# EAGLE design untitledok (EAGLE 7.6.0)

## Sheet 1 of 3
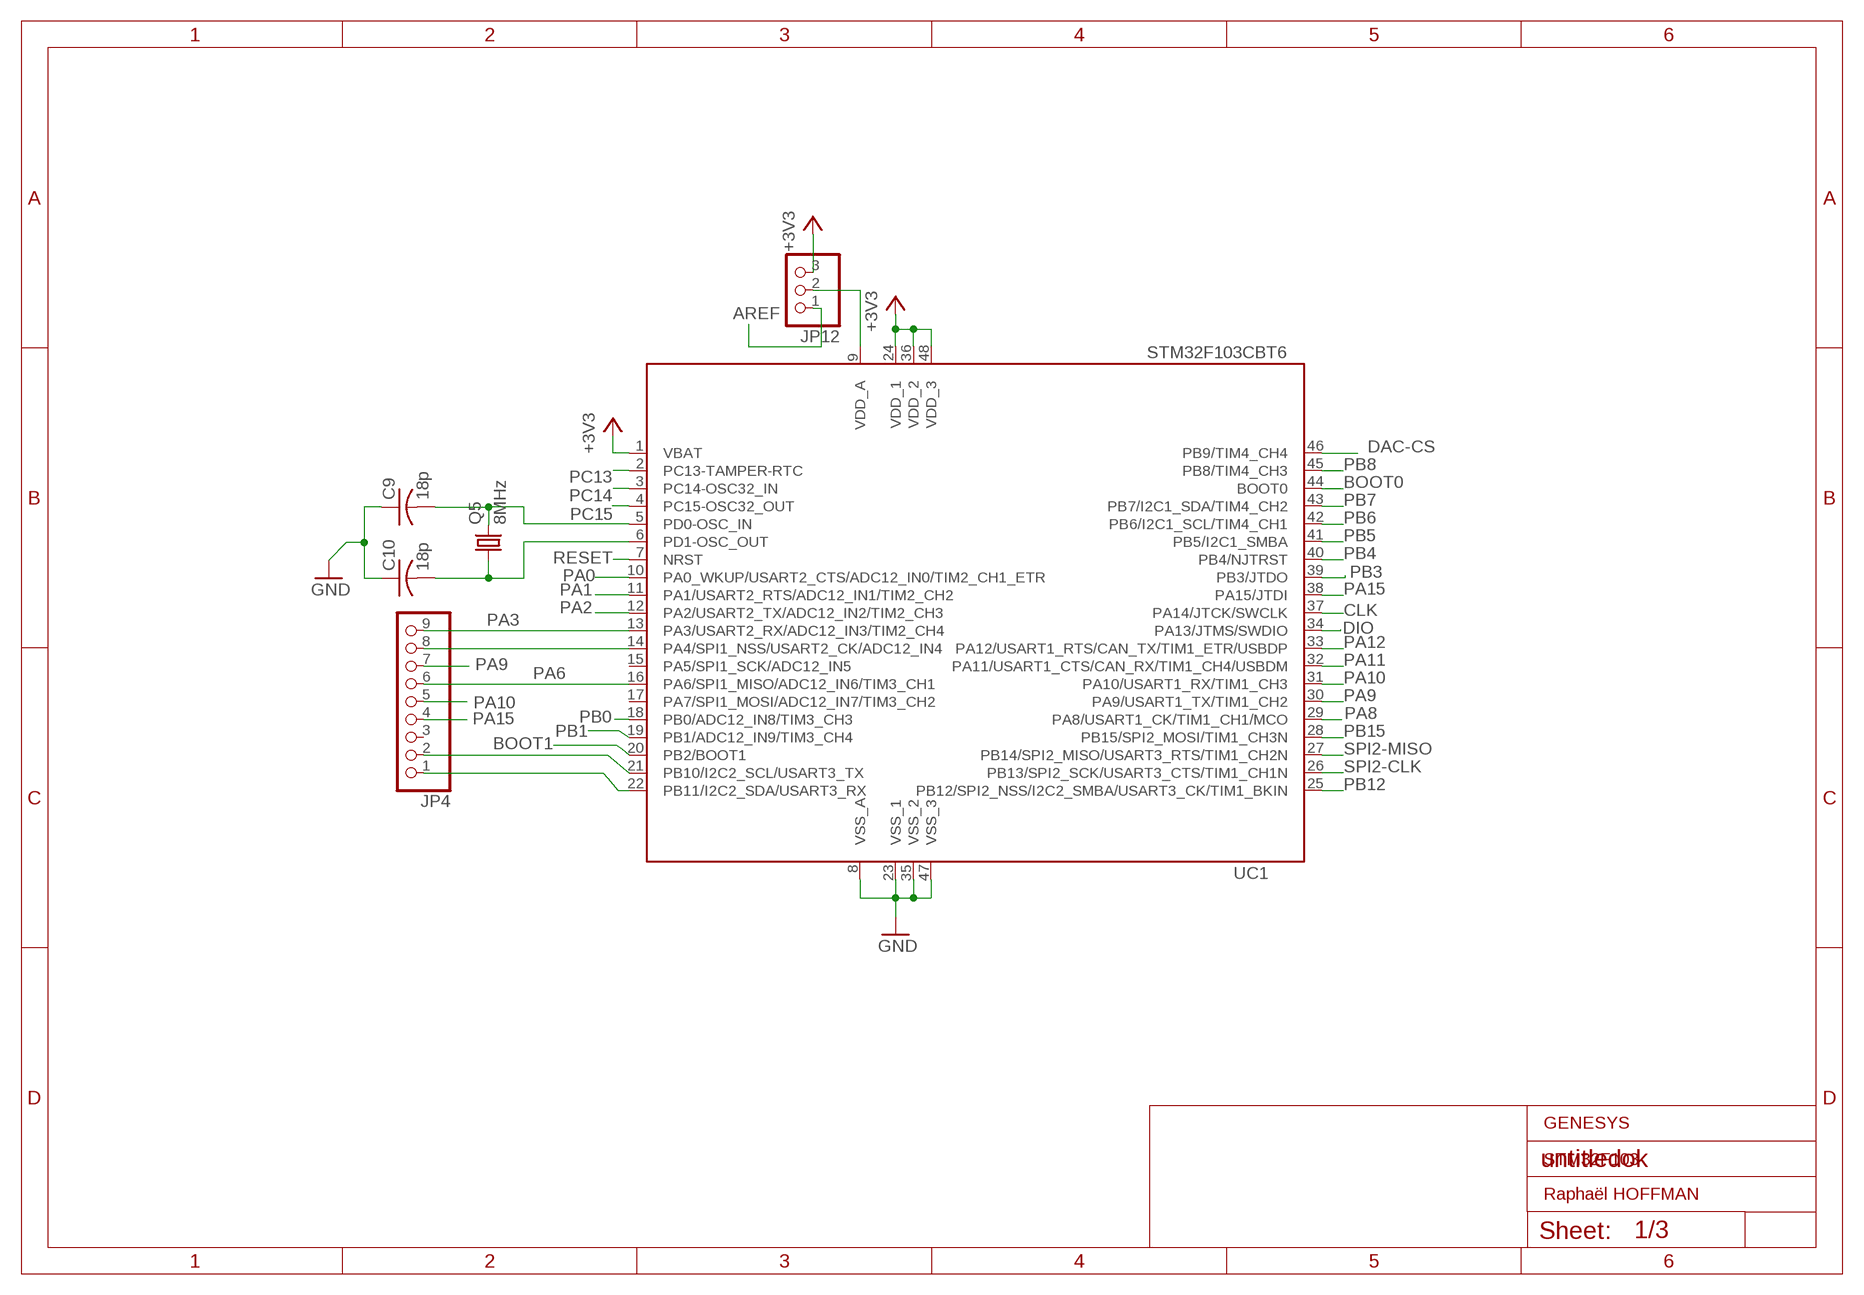
[diagram p0: schematic, sheet 1]

### Parts
C9  18p  C-USC0603  [C0603]
C10  18p  C-USC0603  [C0603]
JP4  PINHD-1X9  [1X09]
JP12  PINHD-1X3  [1X03]
Q5  8MHz  CRYSTALHC49UP  [HC49UP]
UC1  STM32F103CBT6  STM32F103CB  [LQFP48]

### Nets
+3V3: JP12.3 UC1.1(VBAT) UC1.24(VDD_1) UC1.36(VDD_2) UC1.48(VDD_3) ; also sheet 2,3
AREF: JP12.1 ; also sheet 2,3
BOOT0: UC1.44(BOOT0) ; also sheet 3
BOOT1: UC1.20(PB2/BOOT1) ; also sheet 3
CLK: UC1.37(PA14/JTCK/SWCLK) ; also sheet 3
DAC-CS: UC1.46(PB9/TIM4_CH4) ; also sheet 2
DIO: UC1.34(PA13/JTMS/SWDIO) ; also sheet 3
GND [supply]: C9.1 C10.1 UC1.8(VSS_A) UC1.23(VSS_1) UC1.35(VSS_2) UC1.47(VSS_3) ; also sheet 2,3
N$4: JP12.2 UC1.9(VDD_A)
N$7: C9.2 Q5.2 UC1.5(PD0-OSC_IN)
N$8: C10.2 Q5.1 UC1.6(PD1-OSC_OUT)
N$22: JP4.1 UC1.22(PB11/I2C2_SDA/USART3_RX)
N$29: JP4.8 UC1.14(PA4/SPI1_NSS/USART2_CK/ADC12_IN4)
N$31: JP4.2 UC1.21(PB10/I2C2_SCL/USART3_TX)
PA0: UC1.10(PA0_WKUP/USART2_CTS/ADC12_IN0/TIM2_CH1_ETR) ; also sheet 3
PA1: UC1.11(PA1/USART2_RTS/ADC12_IN1/TIM2_CH2) ; also sheet 3
PA2: UC1.12(PA2/USART2_TX/ADC12_IN2/TIM2_CH3) ; also sheet 3
PA3: JP4.9 UC1.13(PA3/USART2_RX/ADC12_IN3/TIM2_CH4) ; also sheet 2
PA6: JP4.6 UC1.16(PA6/SPI1_MISO/ADC12_IN6/TIM3_CH1) ; also sheet 2
PA8: UC1.29(PA8/USART1_CK/TIM1_CH1/MCO) ; also sheet 3
PA9: JP4.7 UC1.30(PA9/USART1_TX/TIM1_CH2) ; also sheet 3
PA10: JP4.5 UC1.31(PA10/USART1_RX/TIM1_CH3) ; also sheet 3
PA11: UC1.32(PA11/USART1_CTS/CAN_RX/TIM1_CH4/USBDM) ; also sheet 3
PA12: UC1.33(PA12/USART1_RTS/CAN_TX/TIM1_ETR/USBDP) ; also sheet 2
PA15: JP4.4 UC1.38(PA15/JTDI)
PB0: UC1.18(PB0/ADC12_IN8/TIM3_CH3) ; also sheet 2
PB1: UC1.19(PB1/ADC12_IN9/TIM3_CH4) ; also sheet 2
PB3: UC1.39(PB3/JTDO)
PB4: UC1.40(PB4/NJTRST) ; also sheet 3
PB5: UC1.41(PB5/I2C1_SMBA) ; also sheet 3
PB6: UC1.42(PB6/I2C1_SCL/TIM4_CH1) ; also sheet 2
PB7: UC1.43(PB7/I2C1_SDA/TIM4_CH2) ; also sheet 3
PB8: UC1.45(PB8/TIM4_CH3) ; also sheet 3
PB12: UC1.25(PB12/SPI2_NSS/I2C2_SMBA/USART3_CK/TIM1_BKIN) ; also sheet 3
PB15: UC1.28(PB15/SPI2_MOSI/TIM1_CH3N) ; also sheet 2,3
PC13: UC1.2(PC13-TAMPER-RTC) ; also sheet 3
PC14: UC1.3(PC14-OSC32_IN) ; also sheet 3
PC15: UC1.4(PC15-OSC32_OUT) ; also sheet 3
RESET: UC1.7(NRST) ; also sheet 3
SPI2-CLK: UC1.26(PB13/SPI2_SCK/USART3_CTS/TIM1_CH1N) ; also sheet 2,3
SPI2-MISO: UC1.27(PB14/SPI2_MISO/USART3_RTS/TIM1_CH2N) ; also sheet 3
Unconnected: JP4.3 UC1.15(PA5/SPI1_SCK/ADC12_IN5) UC1.17(PA7/SPI1_MOSI/ADC12_IN7/TIM3_CH2)

### Notes on the sheet
- GENESYS
- STM32F103
- Raphaël HOFFMAN

## Sheet 2 of 3
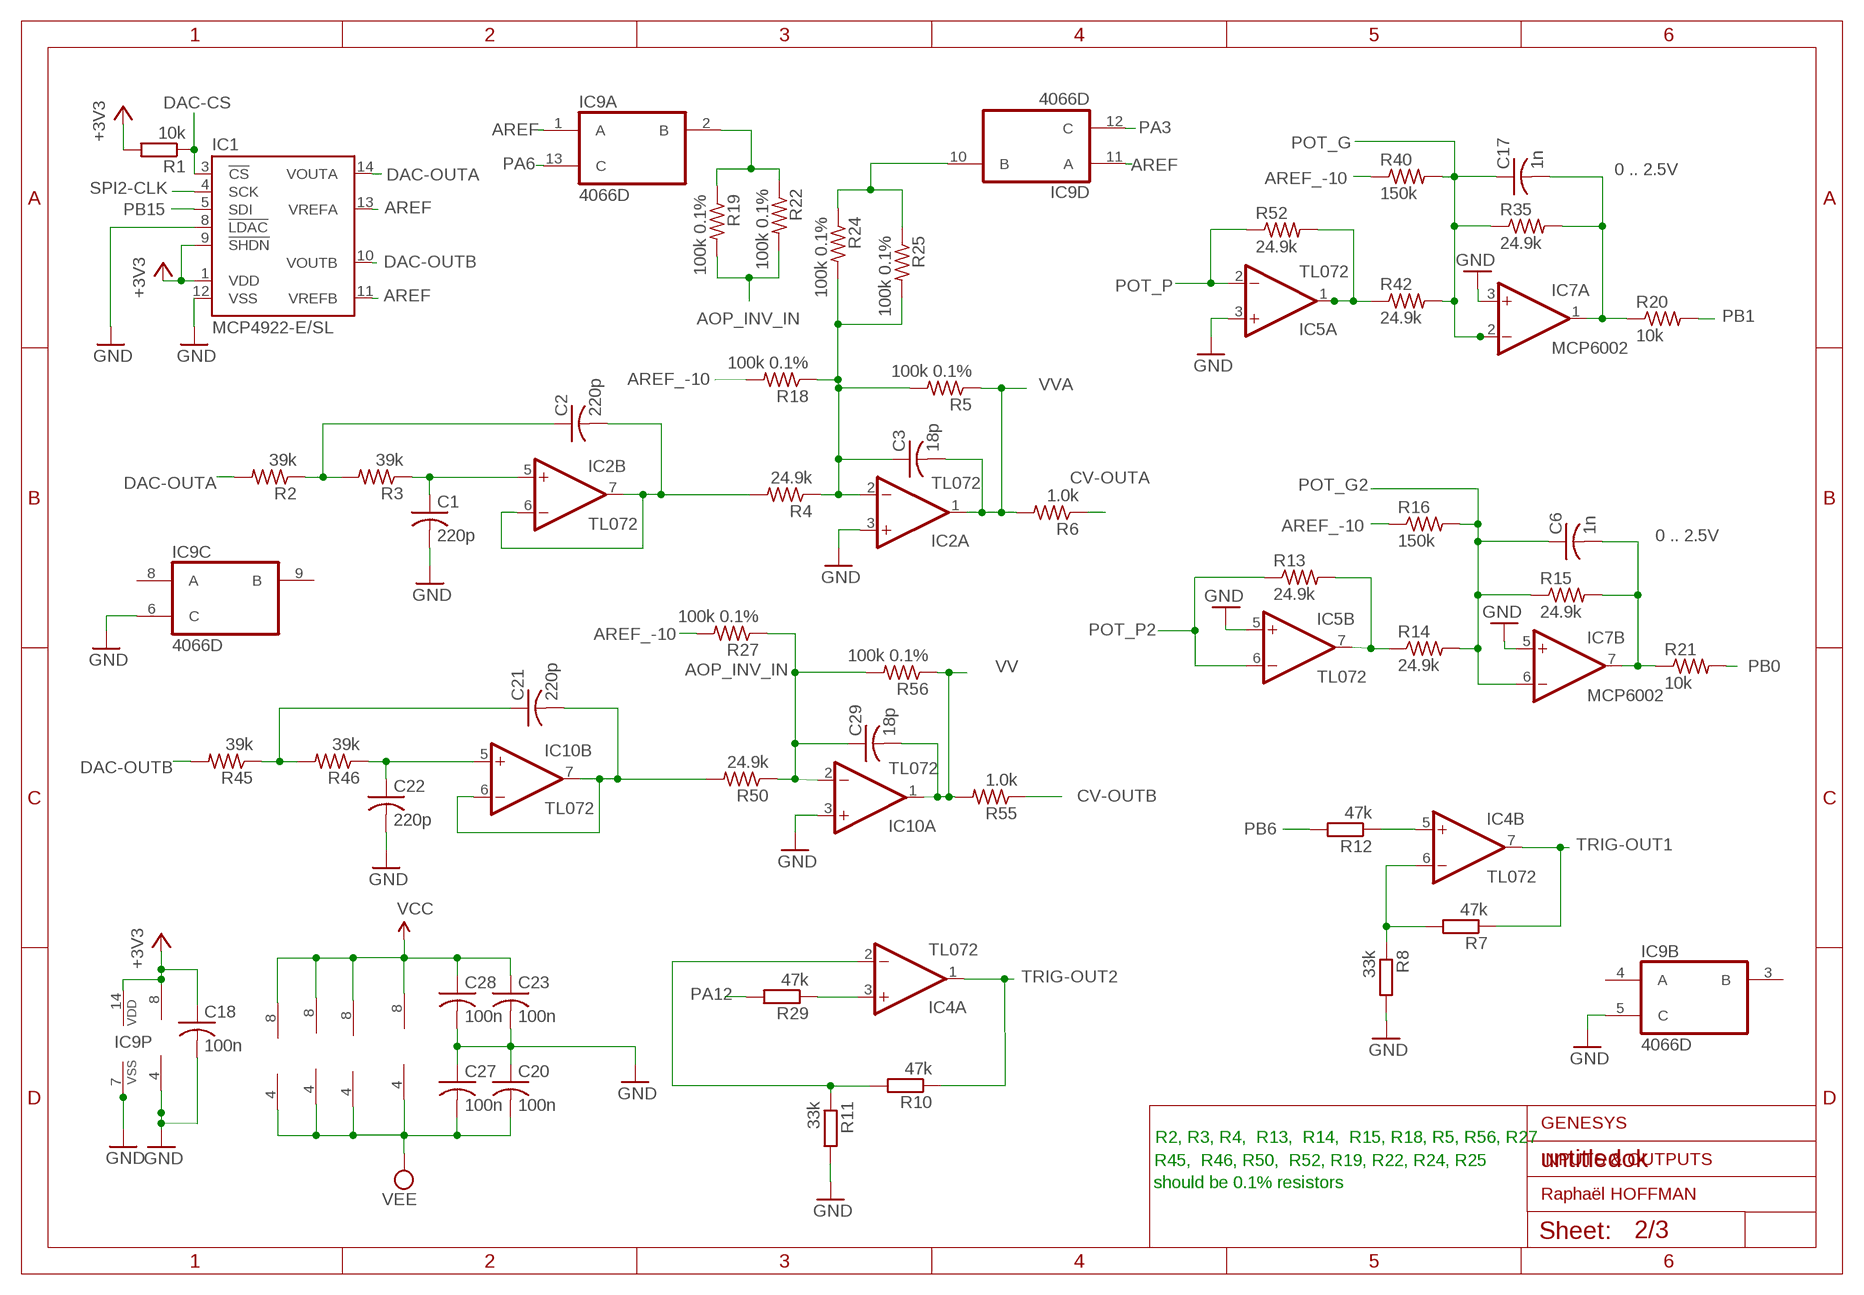
[diagram p1: schematic, sheet 2]

### Parts
C1  220p  C-USC0603  [C0603]
C2  220p  C-USC0603  [C0603]
C3  18p  C-USC0603  [C0603]
C6  1n  C-USC0603  [C0603]
C17  1n  C-USC0603  [C0603]
C18  100n  C-USC0603  [C0603]
C20  100n  C-USC0603  [C0603]
C21  220p  C-USC0603  [C0603]
C22  220p  C-USC0603  [C0603]
C23  100n  C-USC0603  [C0603]
C27  100n  C-USC0603  [C0603]
C28  100n  C-USC0603  [C0603]
C29  18p  C-USC0603  [C0603]
IC1  MCP4922-E/SL  [SO14]
IC2  TL072  TL072D  [SO08]
IC4  TL072  TL072D  [SO08]
IC5  TL072  TL072D  [SO08]
IC7  MCP6002  OP262GS  [SO08]
IC9  4066D  [SO14]
IC10  TL072  TL072D  [SO08]
R1  10k  R-EU_R0603  [R0603]
R2  39k  R-US_R0603  [R0603]
R3  39k  R-US_R0603  [R0603]
R4  24.9k  R-US_R0603  [R0603]
R5  100k 0.1%  R-US_R0805  [R0805]
R6  1.0k  R-US_R0603  [R0603]
R7  47k  R-EU_R0603  [R0603]
R8  33k  R-EU_R0603  [R0603]
R10  47k  R-EU_R0603  [R0603]
R11  33k  R-EU_R0603  [R0603]
R12  47k  R-EU_R0603  [R0603]
R13  24.9k  R-US_R0603  [R0603]
R14  24.9k  R-US_R0603  [R0603]
R15  24.9k  R-US_R0603  [R0603]
R16  150k  R-US_R0603  [R0603]
R18  100k 0.1%  R-US_R0805  [R0805]
R19  100k 0.1%  R-US_R0805  [R0805]
R20  10k  R-US_R0603  [R0603]
R21  10k  R-US_R0603  [R0603]
R22  100k 0.1%  R-US_R0805  [R0805]
R24  100k 0.1%  R-US_R0805  [R0805]
R25  100k 0.1%  R-US_R0805  [R0805]
R27  100k 0.1%  R-US_R0805  [R0805]
R29  47k  R-EU_R0603  [R0603]
R35  24.9k  R-US_R0603  [R0603]
R40  150k  R-US_R0603  [R0603]
R42  24.9k  R-US_R0603  [R0603]
R45  39k  R-US_R0603  [R0603]
R46  39k  R-US_R0603  [R0603]
R50  24.9k  R-US_R0603  [R0603]
R52  24.9k  R-US_R0603  [R0603]
R55  1.0k  R-US_R0603  [R0603]
R56  100k 0.1%  R-US_R0805  [R0805]

### Nets
+3V3: C18.1 IC1.1(VDD) IC1.9(!SHDN) IC7.8(P:V+) IC9.14(P:VDD) R1.2 ; also sheet 1,3
AOP_INV_IN: C29.1 IC10.2(A:-IN) R19.2 R22.2 R27.1 R50.1 R56.2
AREF: IC1.11(VREFB) IC1.13(VREFA) IC9.1(A:A) IC9.11(D:A) ; also sheet 1,3
AREF_-10: R16.1 R18.2 R27.2 R40.1 ; also sheet 3
CV-OUTA: R6.1 ; also sheet 3
CV-OUTB: R55.1 ; also sheet 3
DAC-CS: IC1.3(!CS) R1.1 ; also sheet 1
DAC-OUTA: IC1.14(VOUTA) R2.2
DAC-OUTB: IC1.10(VOUTB) R45.2
GND [supply]: C1.2 C18.2 C20.1 C22.2 C23.2 C27.1 C28.2 IC1.8(!LDAC) IC1.12(VSS) IC2.3(A:+IN) IC5.3(A:+IN) IC5.5(B:+IN) IC7.3(A:+IN) IC7.4(P:V-) IC7.5(B:+IN) IC9.5(B:C) IC9.6(C:C) IC9.7(P:VSS) IC10.3(A:+IN) R8.2 R11.2 ; also sheet 1,3
N$1: C2.2 IC2.6(B:-IN) IC2.7(B:OUT) R4.2
N$2: C1.1 IC2.5(B:+IN) R3.1
N$3: C2.1 R2.1 R3.2
N$5: IC4.3(A:+IN) R29.1
N$9: C3.1 IC2.2(A:-IN) R4.1 R5.2 R18.1 R24.2 R25.2
N$11: IC4.6(B:-IN) R7.2 R8.1
N$14: IC4.5(B:+IN) R12.1
N$16: IC5.7(B:OUT) R13.2 R14.1
N$17: IC9.2(A:B) R19.1 R22.1
N$18: IC4.2(A:-IN) R10.2 R11.1
N$20: IC9.10(D:B) R24.1 R25.1
N$53: IC5.1(A:OUT) R42.1 R52.2
N$67: C21.2 IC10.6(B:-IN) IC10.7(B:OUT) R50.2
N$69: C22.1 IC10.5(B:+IN) R46.1
N$71: C21.1 R45.1 R46.2
P: C17.2 IC7.1(A:OUT) R20.1 R35.2
PA3: IC9.12(D:C) ; also sheet 1
PA6: IC9.13(A:C) ; also sheet 1
PA12: R29.2 ; also sheet 1
PB0: R21.2 ; also sheet 1
PB1: R20.2 ; also sheet 1
PB6: R12.2 ; also sheet 1
PB15: IC1.5(SDI) ; also sheet 1,3
POT_G: C17.1 IC7.2(A:-IN) R35.1 R40.2 R42.2 ; also sheet 3
POT_G2: C6.1 IC7.6(B:-IN) R14.2 R15.1 R16.2 ; also sheet 3
POT_P: IC5.2(A:-IN) R52.1 ; also sheet 3
POT_P2: IC5.6(B:-IN) R13.1 ; also sheet 3
PPP: C6.2 IC7.7(B:OUT) R15.2 R21.1
SPI2-CLK: IC1.4(SCK) ; also sheet 1,3
TRIG-OUT1: IC4.7(B:OUT) R7.1 ; also sheet 3
TRIG-OUT2: IC4.1(A:OUT) R10.1 ; also sheet 3
VCC: C23.1 C28.1 IC2.8(P:V+) IC4.8(P:V+) IC5.8(P:V+) IC10.8(P:V+) ; also sheet 3
VEE: C20.2 C27.2 IC2.4(P:V-) IC4.4(P:V-) IC5.4(P:V-) IC10.4(P:V-) ; also sheet 3
VV: C29.2 IC10.1(A:OUT) R55.2 R56.1 ; also sheet 3
VVA: C3.2 IC2.1(A:OUT) R5.1 R6.2 ; also sheet 3
Unconnected: IC9.3(B:B) IC9.4(B:A) IC9.8(C:A) IC9.9(C:B)

### Notes on the sheet
- 0 .. 2.5V
- 0 .. 2.5V
- GENESYS
- R2, R3, R4,  R13,  R14,  R15, R18, R5, R56, R27
- R45,  R46, R50,  R52, R19, R22, R24, R25 | INPUTS & OUTPUTS
- should be 0.1% resistors
- Raphaël HOFFMAN

## Sheet 3 of 3
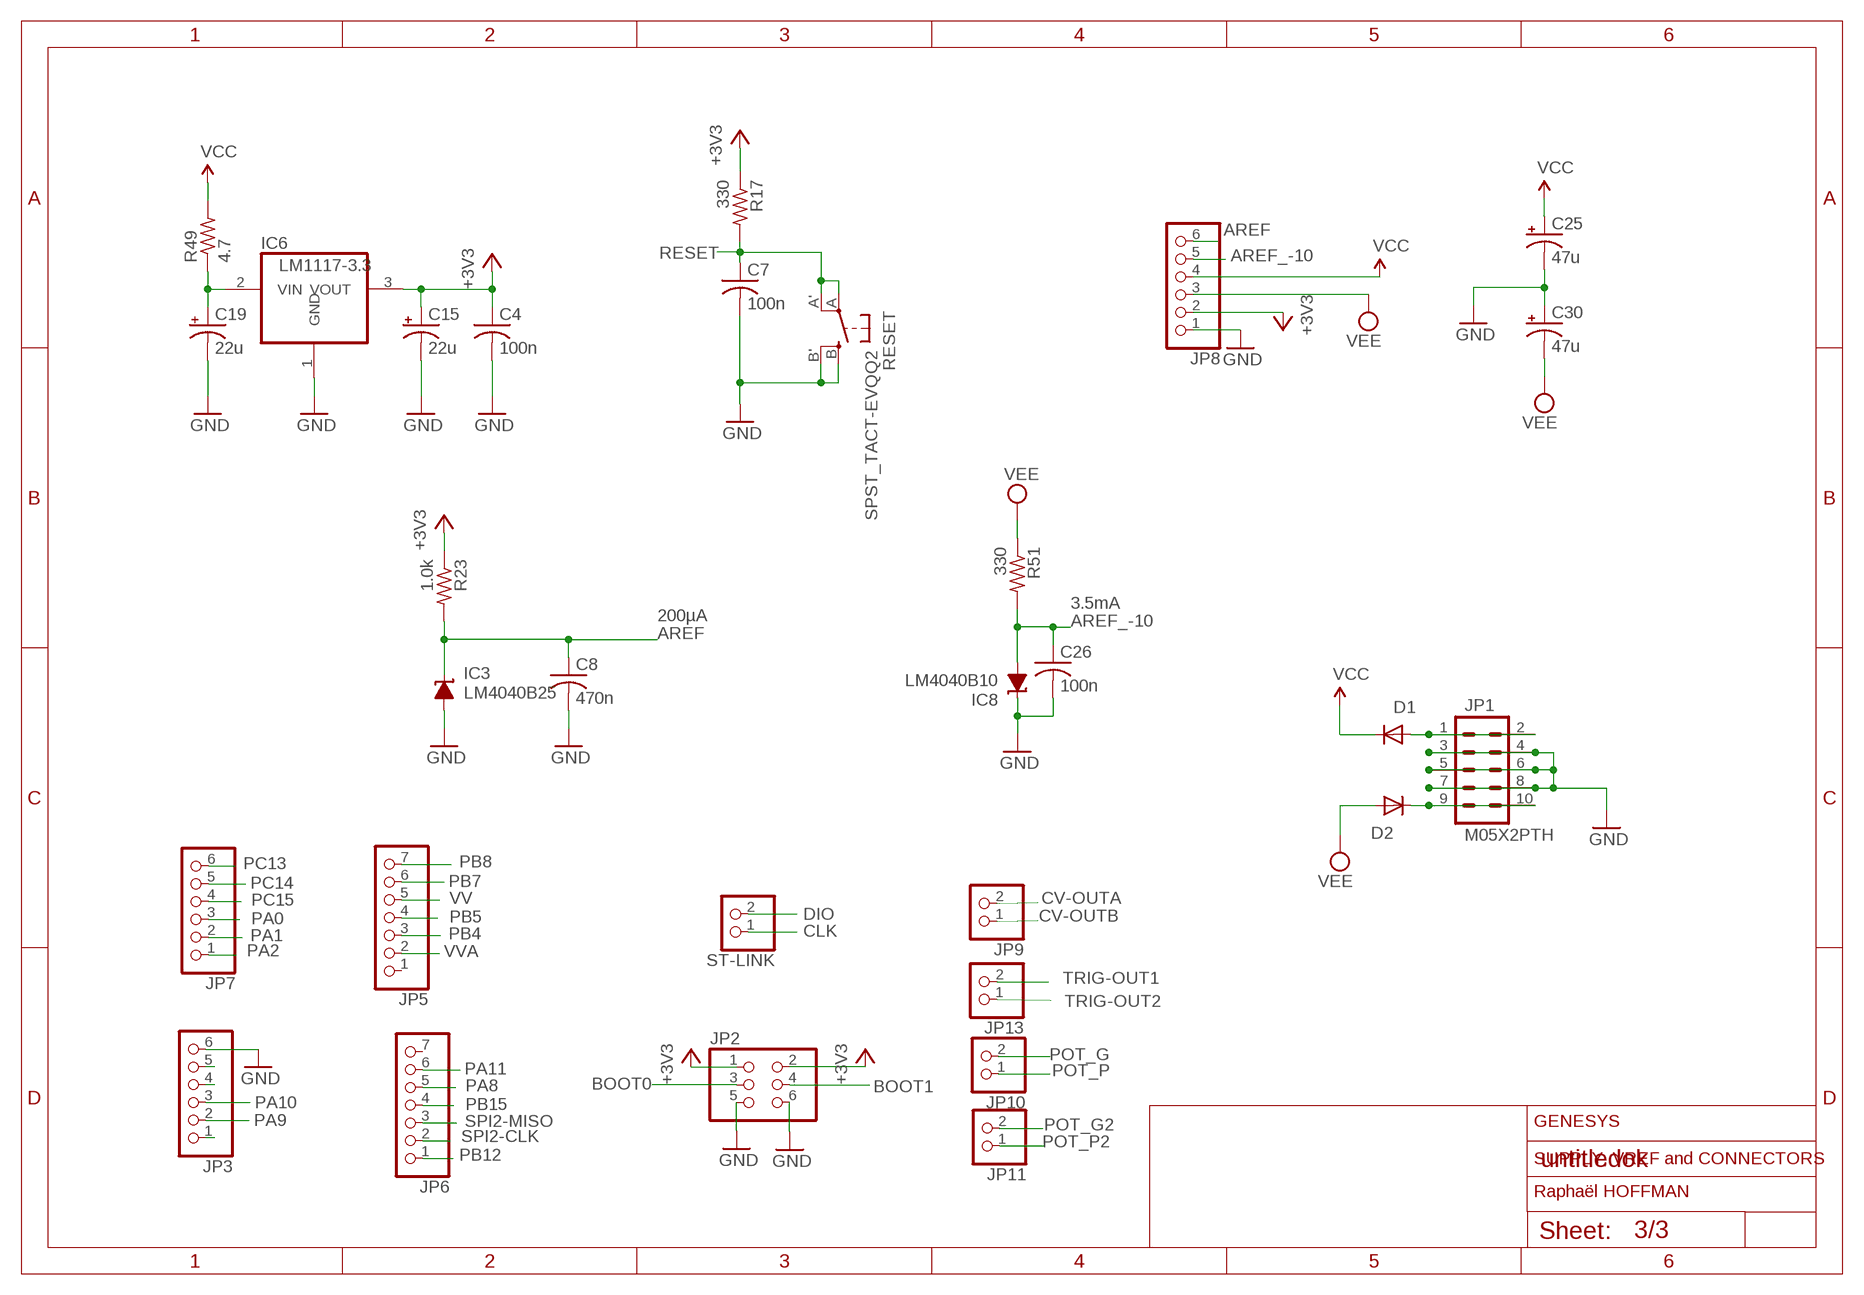
[diagram p2: schematic, sheet 3]

### Parts
C4  100n  C-USC0603  [C0603]
C7  100n  C-USC0603  [C0603]
C8  470n  C-USC0603  [C0603]
C15  22u  CPOL-USC  [PANASONIC_C]
C19  22u  CPOL-USC  [PANASONIC_C]
C25  47u  CPOL-USD  [PANASONIC_D]
C26  100n  C-USC0603  [C0603]
C30  47u  CPOL-USD  [PANASONIC_D]
D1  1N5819HW  DIODE-SOD123  [SOD123]
D2  1N5819HW  DIODE-SOD123  [SOD123]
IC3  LM4040B25  LM4041B12DBZ  [DBZ_R-PDSO-G3]
IC6  LM1117-3.3  REG1117T  [TO252]
IC8  LM4040B10  LM4041B12DBZ  [DBZ_R-PDSO-G3]
JP1  M05X2PTH  [AVR_ICSP]
JP2  PINHD-2X3  [2X03]
JP3  PINHD-1X6  [1X06]
JP5  PINHD-1X7  [1X07]
JP6  PINHD-1X7  [1X07]
JP7  PINHD-1X6  [1X06]
JP8  PINHD-1X6  [1X06]
JP9  PINHD-1X2  [1X02]
JP10  PINHD-1X2  [1X02]
JP11  PINHD-1X2  [1X02]
JP13  PINHD-1X2  [1X02]
R17  330  R-US_R0603  [R0603]
R23  1.0k  R-US_R0603  [R0603]
R49  4.7  R-US_R1206  [R1206]
R51  330  R-US_R0603  [R0603]
RESET  SPST_TACT-EVQQ2  [EVQ-Q2]
ST-LINK  PINHD-1X2  [1X02]

### Nets
+3V3: C4.1 C15.+ IC6.3(VOUT) JP2.1 JP2.2 JP8.2 R17.1 R23.1 ; also sheet 1,2
AREF: C8.1 IC3.1(C) JP8.6 R23.2 ; also sheet 1,2
AREF_-10: C26.1 IC8.2(A) JP8.5 R51.2 ; also sheet 2
BOOT0: JP2.3 ; also sheet 1
BOOT1: JP2.4 ; also sheet 1
CLK: ST-LINK.1 ; also sheet 1
CV-OUTA: JP9.2 ; also sheet 2
CV-OUTB: JP9.1 ; also sheet 2
DIO: ST-LINK.2 ; also sheet 1
GND [supply]: C4.2 C7.2 C8.2 C15.- C19.- C25.- C26.2 C30.+ IC3.2(A) IC6.1(GND) IC8.1(C) JP1.3 JP1.4 JP1.5 JP1.6 JP1.7 JP1.8 JP2.5 JP2.6 JP3.6 JP8.1 RESET.B'(S1) RESET.B(S) ; also sheet 1,2
N$6: JP3.1
N$10: JP3.4
N$15: JP3.5
N$49: C19.+ IC6.2(VIN) R49.1
N$56 [supply]: D1.A JP1.1 JP1.2
N$64 [supply]: D2.C JP1.9 JP1.10
PA0: JP7.3 ; also sheet 1
PA1: JP7.2 ; also sheet 1
PA2: JP7.1 ; also sheet 1
PA8: JP6.5 ; also sheet 1
PA9: JP3.2 ; also sheet 1
PA10: JP3.3 ; also sheet 1
PA11: JP6.6 ; also sheet 1
PB4: JP5.3 ; also sheet 1
PB5: JP5.4 ; also sheet 1
PB7: JP5.6 ; also sheet 1
PB8: JP5.7 ; also sheet 1
PB12: JP6.1 ; also sheet 1
PB15: JP6.4 ; also sheet 1,2
PC13: JP7.6 ; also sheet 1
PC14: JP7.5 ; also sheet 1
PC15: JP7.4 ; also sheet 1
POT_G: JP10.2 ; also sheet 2
POT_G2: JP11.2 ; also sheet 2
POT_P: JP10.1 ; also sheet 2
POT_P2: JP11.1 ; also sheet 2
RESET: C7.1 R17.2 RESET.A'(P1) RESET.A(P) ; also sheet 1
SPI2-CLK: JP6.2 ; also sheet 1,2
SPI2-MISO: JP6.3 ; also sheet 1
TRIG-OUT1: JP13.2 ; also sheet 2
TRIG-OUT2: JP13.1 ; also sheet 2
VCC: C25.+ D1.C JP8.4 R49.2 ; also sheet 2
VEE: C30.- D2.A JP8.3 R51.1 ; also sheet 2
VV: JP5.5 ; also sheet 2
VVA: JP5.2 ; also sheet 2
Unconnected: JP5.1 JP6.7

### Notes on the sheet
- 3.5mA
- 200µA
- GENESYS
- SUPPLY, VREF and CONNECTORS
- Raphaël HOFFMAN

## Library data of the parts
C1-C4 C6-C10 C17 C18 C20-C23 C26-C29 = rcl:C-US: CAPACITOR, American symbol
C15 C19 C25 C30 = rcl:CPOL-US: POLARIZED CAPACITOR, American symbol
D1 D2 = diode:DIODE-: DIODE
IC1 = nh-ic:MCP4922: Microchip MCP4922 According to datasheet http://ww1.microchip.com/downloads/en/DeviceDoc/22250A.pdf. Created by Nils Hintze <n.hintze@elektronikpage.net>
IC2 IC4 IC5 IC10 = linear:TL072: OP AMP
IC3 IC8 = texas:LM4041: PRECISION MICROPOWER SHUNT VOLTAGE REFERENCE Source: http://focus.ti.com/lit/ds/slcs146e/slcs146e.pdf
IC6 = og-vreg:REG1117: 800mA and 1A Low Dropout (LDO) Positive Regulator 1.8V, 2.5V, 2.85V, 3.3V, 5V, and Adj
IC7 = linear:OP262G: OP AMP
IC9 = 40xx:4066: Quad bilateral ANALOG SWITCH
JP1 = og-header:M05X2: Header 5x2 Standard 10-pin dual row 0.1" header. Commonly used with AVR-ISP. Use with Spark Fun Electronics SKU: PRT-00778
JP2 = pinhead:PINHD-2X3: PIN HEADER
JP3 = adafruit:PINHD-1X6: PIN HEADER
JP4 = pinhead:PINHD-1X9: PIN HEADER
JP5 JP6 = pinhead:PINHD-1X7: PIN HEADER
JP7 JP8 = pinhead:PINHD-1X6: PIN HEADER
JP9-JP11 JP13 ST-LINK = pinhead:PINHD-1X2: PIN HEADER
JP12 = adafruit:PINHD-1X3: PIN HEADER
Q5 = crystal:CRYSTAL: CRYSTAL
R1 R7 R8 R10-R12 R29 = rcl:R-EU_: RESISTOR, European symbol
R2-R6 R13-R25 R27 R35 R40 R42 R45 R46 R49-R52 R55 R56 = rcl:R-US_: RESISTOR, American symbol
RESET = adafruit:SPST_TACT: SMT 6mm switch, EVQQ2 series http://www.ladyada.net/library/eagle
UC1 = stm32:STM32F103CB

## Board
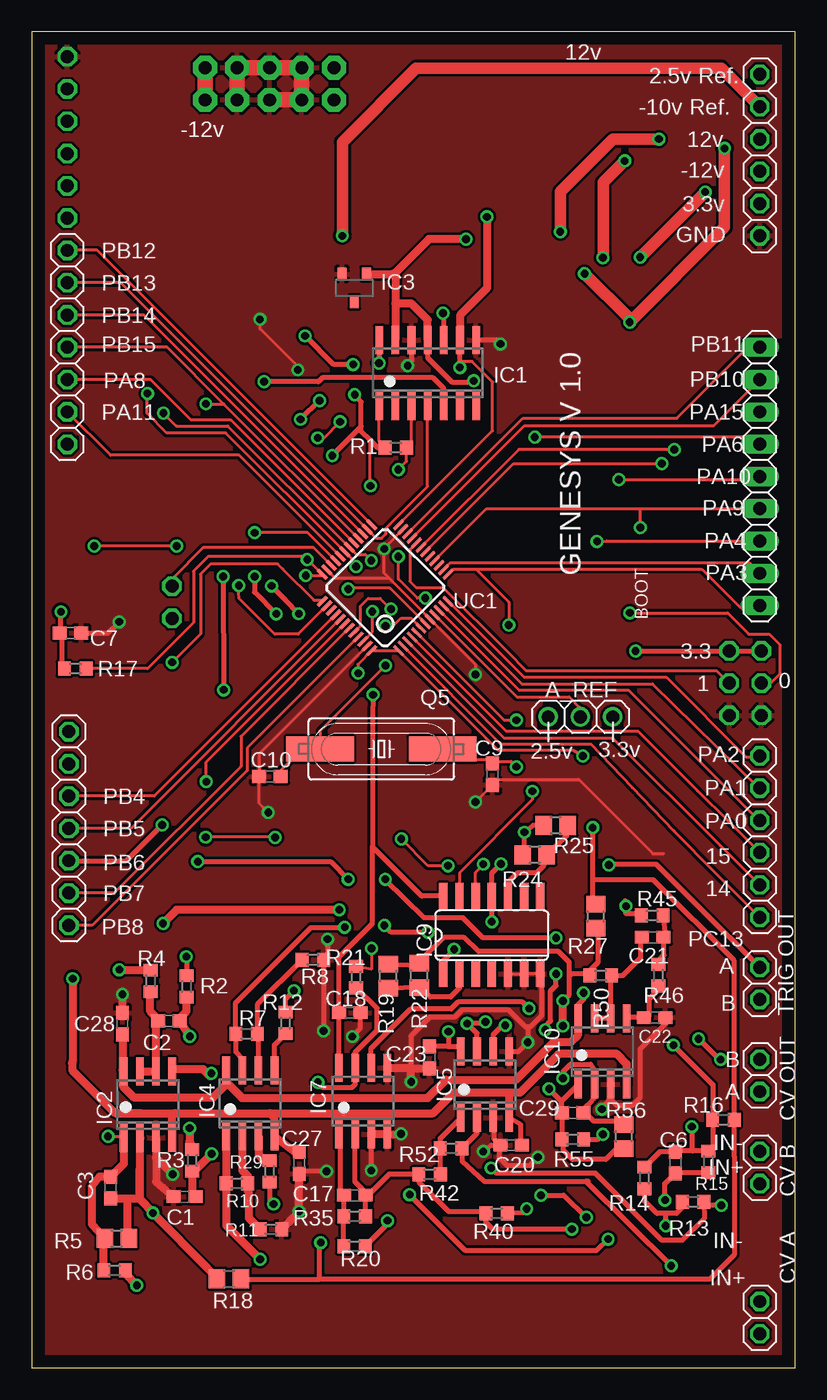
[diagram p3: board, top side]
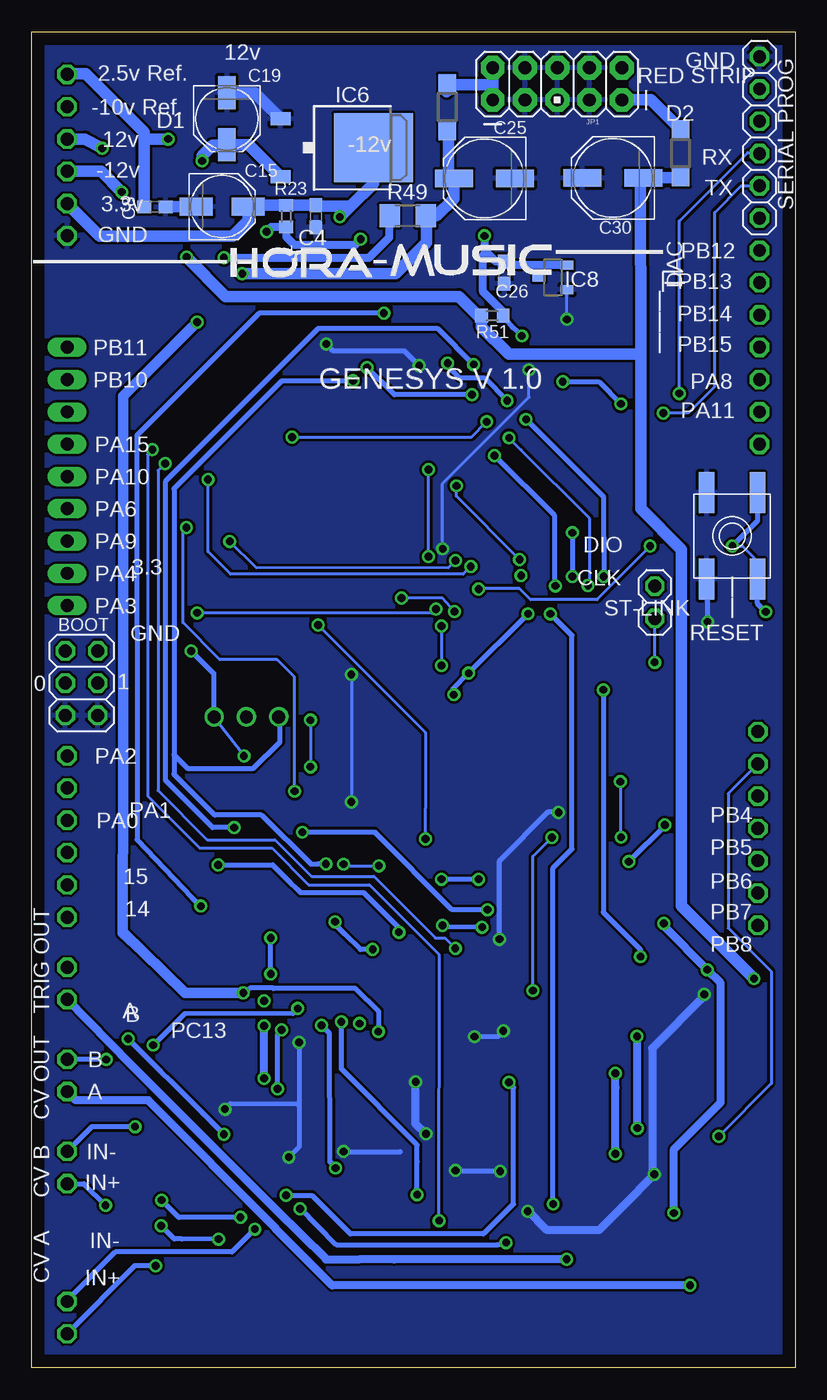
[diagram p4: board, bottom side, seen from below]

Size 60.05 x 105.08 mm. Coordinates in mm from the lower left corner, seen from the top.
Outline: 0,0 60.05,0 60.05,105.08 0,105.08 0,0
Copper layers (1*16): Top 0.035mm / dielectric 1.5mm / Bottom 0.035mm
Design rules "default *": minimum track width 10mil, minimum drill 24mil, track to track 8mil, track to pad 8mil, pad to pad 8mil, via to via 8mil, smd to smd 8mil, copper to edge 40mil, drill to drill 8mil, minimum pad ring 10mil, minimum via ring 8mil, stop-mask expansion 4mil, vias tented up to drill 0mil, thermal gap 10mil

### Footprints (pad centres in the part's own frame; a part is rotated, then mirrored left to right if it is on the bottom)
C0603 = smd 1.1 x 1: 1 -0.85,0; 2 0.85,0
PANASONIC_C = smd 2.6 x 1.4: + 2.05,0; - -2.05,0
PANASONIC_D = smd 3 x 1.4: + 2.4,0; - -2.4,0
SOD123 = smd 1.4 x 1.4: A 1.9,0; C -1.9,0
SO14 = smd 0.6 x 2.2: 1 -3.81,-2.6; 2 -2.54,-2.6; 3 -1.27,-2.6; 4 0,-2.6; 5 1.27,-2.6; 6 2.54,-2.6; 7 3.81,-2.6; 8 3.81,2.6; 9 2.54,2.6; 10 1.27,2.6; 11 0,2.6; 12 -1.27,2.6; 13 -2.54,2.6; 14 -3.81,2.6
SO08 = smd 0.6 x 2.2: 1 -1.905,-2.6; 2 -0.635,-2.6; 3 0.635,-2.6; 4 1.905,-2.6; 5 1.905,2.6; 6 0.635,2.6; 7 -0.635,2.6; 8 -1.905,2.6
DBZ_R-PDSO-G3 = smd 0.7 x 1: 1 -0.95,-1.1; 2 0.95,-1.1; 3 0,1.1
TO252 = smd 1 x 1.6: 1 -2.28,-4.8; 2 2.28,-4.8 | smd 5.4 x 6.2: 3 0,2.5
SO14' = smd 0.66 x 2.032: 1 -3.81,-3.073; 2 -2.54,-3.073; 3 -1.27,-3.073; 4 0,-3.073; 5 1.27,-3.073; 6 2.54,-3.073; 7 3.81,-3.073; 8 3.81,3.073; 9 2.54,3.073; 10 1.27,3.073; 11 0,3.073; 12 -1.27,3.073; 13 -2.54,3.073; 14 -3.81,3.073
AVR_ICSP = drill 1.016 pad 1.88 octagon: 1 -1.27,5.08; 2 1.27,5.08; 3 -1.27,2.54; 4 1.27,2.54; 5 -1.27,0; 6 1.27,0; 7 -1.27,-2.54; 8 1.27,-2.54; 9 -1.27,-5.08; 10 1.27,-5.08
2X03 = drill 1.016 octagon: 1 -2.54,-1.27; 2 -2.54,1.27; 3 0,-1.27; 4 0,1.27; 5 2.54,-1.27; 6 2.54,1.27
1X06 = drill 1.016 octagon: 1 -6.35,0; 2 -3.81,0; 3 -1.27,0; 4 1.27,0; 5 3.81,0; 6 6.35,0
1X09 = drill 1.016 long: 1 -10.16,0; 2 -7.62,0; 3 -5.08,0; 4 -2.54,0; 5 0,0; 6 2.54,0; 7 5.08,0; 8 7.62,0; 9 10.16,0
1X07 = drill 1.016 octagon: 1 -7.62,0; 2 -5.08,0; 3 -2.54,0; 4 0,0; 5 2.54,0; 6 5.08,0; 7 7.62,0
1X02 = drill 1.016 octagon: 1 -1.27,0; 2 1.27,0
1X03 = drill 1.016: 1 -2.54,0; 2 0,0; 3 2.54,0
HC49UP = smd 5.334 x 1.93: 1 -4.826,0; 2 4.826,0
R0603 = smd 1 x 1.1: 1 -0.85,0; 2 0.85,0
R0805 = smd 1.3 x 1.5: 1 -0.95,0; 2 0.95,0
R1206 = smd 1.6 x 1.803: 1 -1.422,0; 2 1.422,0
EVQ-Q2 = smd 3.2 x 1.2: A -3.4,-2; A' 3.4,-2; B -3.4,2; B' 3.4,2
LQFP48 = smd 0.254 x 1: 1 -2.75,-4.25; 2 -2.25,-4.25; 3 -1.75,-4.25; 4 -1.25,-4.25; 5 -0.75,-4.25; 6 -0.25,-4.25; 7 0.25,-4.25; 8 0.75,-4.25; 9 1.25,-4.25; 10 1.75,-4.25; 11 2.25,-4.25; 12 2.75,-4.25; 25 2.75,4.25; 26 2.25,4.25; 27 1.75,4.25; 28 1.25,4.25; 29 0.75,4.25; 30 0.25,4.25; 31 -0.25,4.25; 32 -0.75,4.25; 33 -1.25,4.25; 34 -1.75,4.25; 35 -2.25,4.25; 36 -2.75,4.25 | smd 1 x 0.254: 13 4.25,-2.75; 14 4.25,-2.25; 15 4.25,-1.75; 16 4.25,-1.25; 17 4.25,-0.75; 18 4.25,-0.25; 19 4.25,0.25; 20 4.25,0.75; 21 4.25,1.25; 22 4.25,1.75; 23 4.25,2.25; 24 4.25,2.75; 37 -4.25,2.75; 38 -4.25,2.25; 39 -4.25,1.75; 40 -4.25,1.25; 41 -4.25,0.75; 42 -4.25,0.25; 43 -4.25,-0.25; 44 -4.25,-0.75; 45 -4.25,-1.25; 46 -4.25,-1.75; 47 -4.25,-2.25; 48 -4.25,-2.75

### Placement (x,y rotation side)
C1  12.03,13.46 180 top
C2  10.79,27.28 180 top
C3  6.21,14.17 90 top
C4  37.7,90.58 270 bottom
C6  50.64,16.15 270 top
C7  3.05,57.79 0 top
C8  50.37,91.3 0 bottom
C9  36.25,46.69 90 top
C10  18.73,46.5 0 top
C15  45.08,91.33 0 bottom
C17  25.41,13.58 180 top
C18  25.01,27.92 0 top
C19  44.7,98.23 270 bottom
C20  37.71,17.5 0 top
C21  48.86,33.86 180 top
C22  49.01,27.54 0 top
C23  31.3,24.41 270 top
C25  24.43,93.55 180 bottom
C26  22.88,86.14 270 bottom
C27  21.05,16.11 90 top
C28  7.13,27.06 90 top
C29  42.57,20.04 180 top
C30  14.34,93.58 180 bottom
D1  27.36,99.16 90 bottom
D2  9.01,95.52 270 bottom
IC1  31.15,78.24 0 top
IC2  9.14,20.7 0 top
IC3  25.38,84.93 180 top
IC4  17.19,20.79 0 top
IC5  35.66,22.27 0 top
IC6  35.67,95.96 270 bottom
IC7  26.07,20.97 0 top
IC8  19.05,85.76 90 bottom
IC9  4066D  [SO14']  36.19,34.03 0 top
IC10  44.9,24.87 0 top
JP1  18.71,100.99 90 bottom
JP2  56.13,53.85 270 bottom
JP3  2.79,96.77 90 bottom
JP4  57.28,70.1 270 top
JP5  2.92,42.42 270 top
JP6  2.79,80.26 270 top
JP7  57.28,41.78 270 top
JP8  57.28,95.38 90 top
JP9  57.28,22.99 270 top
JP10  57.28,3.94 90 top
JP11  57.28,15.75 90 top
JP12  43.17,51.19 0 top
JP13  57.28,30.23 90 top
Q5  27.51,48.67 0 top
R1  28.63,72.37 180 top
R2  12.17,29.99 90 top
R3  12.62,16.31 90 top
R4  9.35,30.43 270 top
R5  6.69,10.17 0 top
R6  6.52,7.66 180 top
R7  16.9,26.24 0 top
R8  22.12,32.1 0 top
R10  16.13,14.49 0 top
R11  18.82,10.9 0 top
R12  19.96,27.12 90 top
R13  52.03,13.05 180 top
R14  48.21,14.92 90 top
R15  53.24,16.2 270 top
R16  54.41,19.51 180 top
R17  3.43,54.99 180 top
R18  15.52,6.99 0 top
R19  28.05,30.81 90 top
R20  25.39,9.57 0 top
R21  25.53,30.72 90 top
R22  30.48,30.86 90 top
R23  40.03,90.58 270 bottom
R24  39.57,40.34 180 top
R25  41.22,42.65 180 top
R27  44.37,35.51 90 top
R29  18.72,15.45 270 top
R35  25.41,11.92 180 top
R40  36.57,12.15 180 top
R42  31.3,15.21 180 top
R45  48.82,35.57 180 top
R46  49.28,30.88 90 top
R49  30.47,90.6 0 bottom
R50  44.77,30.85 0 top
R51  23.81,82.74 0 bottom
R52  32.99,17.26 180 top
R55  42.56,17.95 180 top
R56  46.59,18.19 90 top
RESET  4.95,65.43 90 bottom
ST-LINK  11.03,60.2 90 bottom
UC1  27.8,61.35 45 top

### Tracks (layer width: path | path; a pad name or v marks a point on that pad's centre or on a via)
+3V3  (via drill 0.61)
  Top 0.254: 57.4,56.52 JP2.1 | R1.2 27.34,72.89 IC1.1 | UC1.36 21.69,63.57 | R17.1 9.11,54.99 12.72,58.6 12.72,62.66 13.9,63.83 | 33.69,79.85 33.69,80.25 IC1.9 | UC1.36 21.67,63.6 v21.67,63.57 21.41,63.83 13.9,63.83 | 26.62,72.96 26.62,69.39 v26.64,69.37 | UC1.36 22.81,62.46 | v21.55,62.3 22.74,62.3 UC1.36 | v25.68,54.63 25.66,55.32 UC1.48 UC1.1 36.7,48.57 42.57,48.57 v43.36,48.12 | 33.69,79.19 33.73,79.14 34.65,79.14 36.26,77.53 36.26,73.7 UC1.24 | 13.9,63.83 13.96,63.81 | 25.92,74.03
  Top 0.406: IC7.8 24.17,26.42 C18.1 24.18,32.32 26.8,34.94 26.8,40.98 | JP2.1 JP2.2 v47.51,56.37 | R1.2 27.21,72.37 26.62,72.96 25.92,73.62 25.92,74.03 | 25.92,74.03 25.92,75.98 v25.41,76.53 | v33.67,78.68 33.69,79.19 33.69,80.25 | IC9.14 30.67,37.1 26.8,40.98 | v23.64,71.75 25.92,74.03 | v26.85,52.94 26.8,51.11 26.8,40.98 | v21,59.3 19.97,60.38 v18.86,61.5
  Top 0.61: v35.82,90.52 35.82,84.92 33.69,82.79 33.69,80.86 IC1.9
  Bottom 0.254: v21.67,63.57 26.64,68.54 v26.64,69.37 | 18.91,61.27 v18.86,61.5 | v43.36,48.12 45.71,51.14 JP12.3 | v26.85,52.94 26.92,53.39
  Bottom 0.406: v21,59.3 21.17,59.14 v25.68,54.63 26.92,53.39 | JP12.3 45.71,54.57 v47.51,56.37 | v25.41,76.53 31.53,76.53 v33.67,78.68 | 18.91,61.27 18.91,67.02 v23.64,71.75
  Bottom 0.914: IC6.3 33.17,93.15 34.96,91.36 34.98,91.36 | 34.98,91.36 37.63,91.36 C4.1 R23.1 42.94,91.43 C15.+ 43.03,90.22 44.23,89.02 54.73,89.02 JP8.2 | 34.98,91.36 v35.82,90.52
AOP_INV_IN  (via drill 0.61)
  Top 0.406: R56.2 46.16,19.41 44.2,19.41 43.55,20.04 C29.1 43.42,20.36 44.1,21.04 44.1,21.05 44.29,21.24 44.29,22.25 IC10.2 44.23,22.3 44.23,23.5 43.96,23.86 42.38,23.86 41.8,23.28 v41.78,22.75 | R50.1 43.61,30.79 | R50.1 43.91,30.62 43.92,31.25 44.58,31.91 44.58,34.61 44.37,34.75 R27.1 | v41.78,28.85 42.28,29.33 42.28,30.81 | R50.1 43.76,31.01 42.48,31.01 42.28,30.81 | R19.2 30.43,31.66 R22.2 30.5,31.73 30.52,31.96 32.44,33.84 34.02,33.84 35.15,32.73 41.44,32.73 42.28,31.89 42.28,30.81
  Top 0.61: v41.78,26.88 v41.78,28.85
  Bottom 0.61: v41.78,22.75 v41.78,26.88
AREF  (via drill 0.61)
  Top 0.254: 34.67,77.53 v34.77,77.63
  Top 0.406: IC1.11 31.15,79.44 33.06,77.53 34.67,77.53 | 32.27,30.84 IC9.1 32.38,32.05 v33.23,32.9 | v36.91,39.62 36.19,38.9 IC9.11 36.19,35.87 36.19,35.8 v36.19,35.08
  Top 0.61: v34.17,88.78 31.24,88.78 28.61,86.15 28.61,85.79 | 28.61,85.79 28.61,83.7 | 28.61,83.7 IC1.13 | 49.31,96.63 v49.33,96.64 | IC3.1 28.37,86.03 28.61,85.79 | IC1.11 31.15,82.42 29.87,83.7 28.61,83.7
  Top 0.914: v41.58,89.36 41.59,92.51 45.73,96.63 49.31,96.63
  Bottom 0.254: 40.53,51.1 JP12.1 | 37.56,39.62 36.79,39.62
  Bottom 0.406: 48.86,48.21 48.86,69.14 40.38,77.63 v34.77,77.63 | 40.53,51.1 40.53,49.2 42.62,47.15 47.78,47.15 47.87,47.23 48.86,48.21 | 48.86,48.21 48.86,46.67 45.66,43.46 41.97,43.46 38.1,39.62 37.56,39.62 v36.91,39.62 | v33.23,32.9 34.2,32.9 35.4,34.1 36.18,34.85 v36.19,35.08
  Bottom 0.61: v34.17,88.78 34.62,88.33 39.4,88.33 40.03,88.96 R23.2 41.21,89.73 v41.58,89.36 | 51.12,96.64 51.22,96.54
  Bottom 0.914: C8.1 51.22,96.54 51.22,97.19 55.81,101.77 57.23,101.77 JP8.6 | v49.33,96.64 51.12,96.64
AREF_-10  (via drill 0.61)
  Top 0.406: v38.94,12.5 39.01,12.51 39.01,12.32 38.65,12.18 R40.1 | 44.13,38.39 48.9,38.39 55.26,32.02 R16.1 55.26,16.66 55.26,8.86 53.35,6.96 22.63,6.96 | 44.13,38.39 44.13,38.56 44.13,42.24 v44.13,42.48 | v25.29,78.92 23.75,78.92 v21.5,81.16 | 22.63,6.96 16.82,6.96 16.61,6.99 R18.2 | 22.63,6.96 22.63,9.74 v22.73,9.84 | R27.2 44.13,36.7 44.13,38.39
  Top 0.914: JP8.5 57.28,99.2 54.26,102.22 30.24,102.22 24.43,96.4 v24.43,89.03
  Bottom 0.254: 22.75,86.76 C26.1
  Bottom 0.406: v22.73,9.84 22.84,9.82 23.39,9.69 36.11,9.69 38.95,12.58 v38.94,12.5 | v44.13,42.48 45.83,42.48 49.52,46.19 49.52,69.74 37.49,81.76 28.14,81.76 v25.29,78.92 | v21.5,81.16 22.14,81.79 R51.2
  Bottom 0.61: v24.43,89.03 24.43,87.9 24.28,87.75 | 24.28,87.75 23.56,87.03 22.92,87.03 C26.1 | 22.75,86.76 18,86.76 IC8.2 | R51.2 22.96,83.05 24.53,84.63 24.53,87.49 24.28,87.75
BOOT0  (via drill 0.61)
  Top 0.254: UC1.44 25.86,58.35 25.86,59.9 26.47,60.52 27.41,60.52 v28.25,59.68 | v47.05,59.37 54.74,59.37 56.41,57.71 58.02,57.71 58.84,56.89 58.84,54.55 58.12,53.83 57.42,53.83 JP2.3
  Bottom 0.254: v28.25,59.68 28.58,59.35 46.94,59.35 v47.05,59.37
BOOT1
  Top 0.254: JP2.4 54.85,53.85 53.89,54.81 38.99,54.81 38.94,54.81 37.38,56.36 32.4,61.34 32.37,61.38 30.21,61.38 29.75,61.84 29.75,64.36 UC1.20
CLK  (via drill 0.61)
  Top 0.254: v11.04,55.48 13.29,57.73 13.29,62.41 13.29,62.44 14.08,63.23 19.35,63.23 19.75,62.82 22.2,60.37 22.78,60.37 UC1.37
  Bottom 0.254: v11.04,55.48 11.04,58.92 ST-LINK.1
CV-OUTA  (via drill 0.61)
  Top 0.61: R6.1 7.37,7.37 v8.26,6.48
  Bottom 0.61: v8.26,6.48 36.42,6.48 40.82,10.89 40.89,11.02 50.89,21.04 56.59,21.04 JP9.2
CV-OUTB  (via drill 0.61)
  Top 0.406: R55.1 44.55,17.97 v44.94,18.36 | v52.46,25.87 54.09,24.24 v54.2,24.24
  Bottom 0.406: v44.94,18.36 48.66,22.08 49.07,22.53 49.89,23.3 v52.46,25.87 | v54.2,24.24 57.26,24.24 JP9.1
DAC-CS  (via drill 0.61)
  Top 0.254: 29.64,72.34 R1.1 | R1.1 29.88,72.63 IC1.3 | UC1.46 26.8,57.88 v26.8,59.47 | v28.84,63.8 28.84,62.03 30.33,60.54 v30.96,60.54 | v28.84,70.65 29.48,71.3 R1.1
  Bottom 0.254: v26.8,59.47 27.74,60.55 v30.96,60.54 | v28.84,63.8 v28.84,70.65
DAC-OUTA  (via drill 0.61)
  Top 0.406: IC1.14 v27.34,79.03 v27.33,79.02 | v22.65,76.07 22.63,76.07 v21.16,74.6 | v15.05,62.23 v15.09,53.32 | v12.16,32.33 12.17,32.23 R2.2
  Bottom 0.406: v27.33,79.02 27.33,78.8 26.45,77.92 26.45,77.91 26.42,77.87 24.45,77.87 v22.65,76.07 | v21.16,74.6 15.09,68.53 v15.05,62.23 | v15.09,53.32 15.09,35.83 12.16,32.9 v12.16,32.33
DAC-OUTB  (via drill 0.61)
  Top 0.406: IC1.10 32.42,82.88 v32.35,82.95 | R45.2 48.31,35.71 46.75,35.69 46.69,36.72 v46.75,36.31
  Bottom 0.406: v32.35,82.95 42.17,82.95 51.76,73.35 51.76,58.02 51.76,41.52 47.48,37 46.93,36.45 v46.75,36.31
DIO
  Top 0.254: UC1.34 22.18,64.5 13.48,64.5 11.03,62.05 ST-LINK.2
GND  (via drill 0.61)
  Top 0.254: 4.06,57.79 C7.2 | 29.45,66.18 UC1.23 27.74,64.48 v27.72,64.41 27.72,62.49 28.12,62.1 | UC1.47 17.88,48.26 C10.1 17.88,44.4 18.55,43.73 | 28.12,62.1 UC1.8 34.91,55.31 v34.91,54.52 | v17.95,82.47 17.95,81.73 20.93,78.75 v20.93,78.49 | UC1.35 23.88,62.1 28.12,62.1 | v34.91,44.51 C9.1 36.67,46.27 43.03,46.27 48.86,40.44 49.72,40.44 | IC9.5 IC9.6 IC9.7 | 37.51,28.13 37.51,28.08 38.82,26.81
  Top 0.305: R8.2 22.96,32.12 23.27,32.14 | v18.6,43.68 18.55,43.73
  Top 0.406: 4.06,57.79 5.99,57.79 v6.88,58.67 | 21.16,15.5 22.91,15.5 v23.2,15.45 | v26.71,15.51 26.71,17.38 26.76,17.68 26.75,18.33 IC7.3 | IC5.3 36.35,19.62 36.35,18.01 C20.1 | v35.52,17.01 36.14,17.5 C20.1 | IC5.5 38.3,24.87 v39.02,25.6 39.02,26.81 | C20.1 36.78,17.42 36.78,16.51 37.38,15.91 39.18,15.91 v39.83,16.56 | v44.85,20.33 45.5,21.17 | 45.5,21.17 45.67,21.39 45.67,22.13 IC10.3 45.54,21.44 | 50.17,27.57 C22.2 49.85,27.03 47.85,25.03 47.85,21.24 47.22,20.61 46.06,20.61 45.5,21.17 | R8.2 22.96,32.33 v22.96,26.49 | v25.22,26.04 25.86,26.68 C18.2 | v23.27,33.7 23.27,32.14 | IC1.12 29.88,79.17 v29.57,78.83 | v36.88,80.53 36.56,80.84 IC1.8 | 38.75,26.9 37.51,28.13 33.84,28.15 33.26,27.57 31.31,27.57 29.83,26.09 29.83,23.84 29.56,23.57 | 38.82,26.81 39.02,26.81 | 39.21,26.81 39.23,26.81 | 39.23,26.81 40.12,27.7 40.12,30.84 IC9.7 | 39.23,26.81 39.21,26.83 39.21,26.81 | 39.21,26.81 39.02,26.81
  Top 0.61: v29.04,18.39 29.26,18.37 IC7.4 IC7.3 26.73,18.32 | IC7.5 29.56,23.57 29.85,23.57 | C1.2 9.77,14.62 IC2.3 9.77,16.51 v11.08,15.21 | C28.2 v7.13,29.37 | R11.2 20.54,11.77 v21.04,12.31 21.04,14.54 C27.1 21.16,15.5 | 29.85,23.57 29.86,23.56 C23.2 | v29.85,22.47 v29.85,22.48 29.85,23.57
  Top 1.219: JP1.7 JP1.8 JP1.6 JP1.4 JP1.3 JP1.5
  Bottom 0.254: 6.86,61.85 RESET.B 7.11,62.1 | 7.11,68.71 RESET.B' | v27.72,64.41 27.74,69.54 20.93,76.34 v20.93,78.49 | v17.95,82.47 | v17.95,82.47 IC8.1 | v34.91,54.52 v34.91,44.51
  Bottom 0.305: 23.25,33.84 v23.27,33.7
  Bottom 0.406: v6.88,58.67 6.88,61.95 RESET.B | v23.2,15.45 26.8,15.43 v26.71,15.51 | 39.04,20.8 39.04,17.35 v39.83,16.56 | v39.02,25.6 39.04,20.8 | 39.04,20.8 39.16,20.73 44.44,20.76 v44.85,20.33 | v35.52,17.01 35.32,16.99 31.07,16.99 31.05,16.97 | v22.96,26.49 23.39,26.04 v25.22,26.04 | 23.25,33.84 23.25,39.88 19.39,43.73 18.65,43.73 v18.6,43.68 | v29.57,78.83 30.72,79.98 36.33,79.98 v36.88,80.53
  Bottom 0.61: 22.79,85.37 C26.2 | v29.04,18.39 29.87,19.2 29.87,22.23 v29.85,22.47 | v7.13,29.37 7.13,29.23 11.23,25.13 11.23,15.36 v11.08,15.21 13.6,12.67 13.6,12.65 15.43,10.82 18.7,10.82 19.51,10.82 21.02,12.34 v21.04,12.31
  Bottom 0.914: 44.84,100.14 C19.- 42.52,100.28 IC6.1 | C8.2 49.41,91.33 C15.-
  pour Bottom: 60.06,105.01 60.06,101.98 60.01,101.98 60.01,0.19 0.07,0.19 0.07,105.08
  pour Top: 60.13,105.83 60.13,101.94 60.08,101.94 60.08,0.15 0.14,0.15 -0.03,105.9
N$1
  Top 0.61: IC2.7 IC2.6 9.77,27.11 C2.2 9.94,27.42 9.33,28.03 9.33,29.55 R4.2
N$2  (via drill 0.61)
  Top 0.61: v14.14,16.82 12.91,15.59 R3.1 12.62,13.54 C1.1 | v14.13,23.14 14.01,22.95 13.49,23.47 11.21,23.47 IC2.5
  Bottom 0.61: v14.14,16.82 14.13,22.03 v14.13,23.14
N$3  (via drill 0.61)
  Top 0.61: R2.1 12.17,28.7 12.17,28.03 11.64,27.48 C2.1 11.64,27.26 v12.43,26.06 | v12.41,18.84 12.41,17.8 R3.2
  Bottom 0.61: v12.43,26.06 12.45,18.79 v12.41,18.84
N$4
  Top 0.254: UC1.9 38.15,52.77 42.28,52.77 43.1,51.95 43.1,51.26 JP12.2
N$5
  Top 0.61: R29.1 18.28,16.3 17.86,16.71 17.86,18.15 IC4.3
N$7  (via drill 0.61)
  Top 0.254: 33.01,48.91 Q5.2 | UC1.5 37.16,50.94 v38.13,50.94 | 36.37,47.97 C9.2 | 33.02,48.91 33.94,47.99 34.86,47.99 34.86,47.85 36.25,47.85 C9.2 | v38.13,47.27 37.7,47.7 36.4,47.7 C9.2
  Top 0.406: Q5.2 33.02,48.91
  Bottom 0.254: v38.13,50.94 v38.13,47.27
N$8  (via drill 0.61)
  Top 0.254: 23.36,48.91 Q5.1 | 23.08,48.91 Q5.1 | v27.83,55.23 22.68,50.08 Q5.1 | Q5.1 22.58,48.45 21.05,48.45 19.58,46.98 C10.2 | v27.83,58.34 28.44,58.34 29.05,58.96 29.85,58.96 UC1.6
  Bottom 0.254: v27.83,58.34 v27.83,55.23
N$9  (via drill 0.61)
  Top 0.406: 38.72,42.08 v38.77,42.12 | R25.2 39.47,42.66 v38.77,42.12 | R24.2 38.77,40.17 v38.77,42.12
  Top 0.61: 8.52,18.08 IC2.2 | C3.1 7.5,13.32 | 7.5,13.32 8.49,13.32 8.54,18.06 IC2.2 | 7.5,13.32 7.5,10.22 R5.2 | IC2.2 8.5,13.27 v9.53,12.17 9.53,12.14 13.85,7.82 14.54,7.17 R18.1 | v6.89,31.3 9.33,31.3 R4.1 | v24.19,36.02 11.38,36.02 v10.32,34.96
  Bottom 0.406: v38.77,42.12 33.09,42.12 26.99,36.02 v24.19,36.02
  Bottom 0.61: v9.53,12.17 9.53,17.18 5.85,20.86 5.85,30.26 v6.89,31.3 10.32,34.73 v10.32,34.96
N$11
  Top 0.406: IC4.6 17.83,26.17 R7.2 17.77,28.62 R8.1
N$14
  Top 0.406: IC4.5 19.1,25.41 R12.1
N$16  (via drill 0.61)
  Top 0.406: R13.2 51.18,12.6 50.72,12.14 49.96,12.14 | 49.96,12.14 49.19,12.14 48.23,13.08 48.23,14.05 R14.1 | IC5.7 35.03,26.3 v34.26,27.07 35.56,27.07 v35.7,27.21 | 29.76,13.58 29.71,13.65 v29.73,13.61 34.1,9.24 44.47,9.24 v45.35,10.11 | v49.88,11.16 49.88,12.05 49.96,12.14
  Bottom 0.406: v45.35,10.11 48.25,10.13 48.85,10.13 v49.88,11.16 | v29.73,13.61 29.73,16.22 29.73,17.52 35.7,23.49 v35.7,27.21
N$17
  Top 0.406: R19.1 30.43,29.96 R22.1 31.33,29.16 32.95,29.16 33.65,29.86 IC9.2
N$18
  Top 0.61: R11.1 17.08,11.79 17.08,13.78 16.98,13.88 R10.2 17.01,14.51 17.01,15.07 16.56,15.52 IC4.2
N$20
  Top 0.406: IC9.10 37.46,38.18 38.23,38.95 39.73,38.95 40.33,39.55 40.33,40.25 R24.1 42.07,41.82 R25.1
N$22
  Top 0.254: UC1.22 38.65,74.68 50.77,74.68 56.35,80.26 JP4.1
N$29
  Top 0.254: UC1.14 32.5,62.88 32.94,63.32 56.45,63.32 JP4.8
N$31
  Top 0.254: UC1.21 38.78,74.1 53.65,74.1 JP4.2
  Bottom 0.254: 57.17,77.61 JP4.2
N$49  (via drill 0.61)
  Top 0.914: v44.93,87.32 44.99,87.32 44.95,89.2 44.95,93.23 v46.65,94.93
  Bottom 0.61: R49.1 31.91,90.59 31.91,88.91 33.52,87.3 44.6,87.3 arc90 v44.93,87.32
  Bottom 0.914: C19.+ 42.98,96.18 IC6.2 | R49.1 31.89,90.2 | C19.+ | C19.+ 44.7,95.44 | v46.65,94.93 46.65,95.32 45.83,96.15 44.74,96.15 C19.+
N$53
  Top 0.406: 33.59,19.5 IC5.1 32.14,18.05 R52.2 | R42.1 R52.2 | R52.2
N$56
  Top 1.219: 23.79,99.7 JP1.1
  Bottom 0.914: JP1.1 23.79,100.91 | 23.79,100.91 JP1.2 | D1.A 27.41,100.38 26.87,100.91 23.79,100.91
N$64
  Top 1.219: JP1.10 JP1.9
  Bottom 0.914: JP1.9 11.36,99.75 D2.C
N$67
  Top 0.406: IC10.7 IC10.6 45.57,27.5 45.57,30.8 R50.2 46.49,30.86 47.9,32.28 47.9,33.76 C21.2
N$69
  Top 0.406: R46.1 49.28,29.73 48.54,28.99 48.54,27.58 C22.1 46.88,27.54 IC10.5
N$71
  Top 0.406: R46.2 49.28,32 49.74,32.45 49.74,33.83 C21.1 49.84,34 R45.1
P
  Top 0.406: R20.1 24.54,11.98 R35.2 C17.2 | 24.56,13.82 C17.2 | IC7.1 24.24,18.3 24.24,13.58 C17.2 | 24.33,13.86 C17.2
PA0
  Top 0.254: UC1.10 38.33,53.3 46.94,53.3 57.11,43.14 JP7.3
PA1
  Top 0.254: UC1.11 38.55,53.78 48.83,53.78 57.19,45.59 JP7.2
PA2
  Top 0.254: UC1.12 38.73,54.31 49.91,54.31 56.18,48.04 57.01,48.04 JP7.1
PA3  (via drill 0.61)
  Top 0.254: 33.15,62.82 UC1.13 32.72,62.39 33.15,62.82 | JP4.9 57.17,59.83 55.69,59.83 52.7,62.82 34.94,62.82 | 34.94,62.82 37.53,60.21 v37.53,58.41 | 33.15,62.82 34.94,62.82 | IC9.12 34.92,38.95 v35.52,39.6 | v32.75,39.48 31.19,39.48 v29.08,41.59
  Bottom 0.254: v37.53,58.41 29.08,49.96 29.08,43.98 | v29.08,41.59 29.08,43.98 | 29.08,43.98 | v35.52,39.6 35.4,39.48 v32.75,39.48
PA6  (via drill 0.61)
  Top 0.254: 47.89,67.56 JP4.6 | v47.89,66.09 47.89,67.56 | UC1.16 35.78,67.56 47.89,67.56 | 33.65,37.87 IC9.13 33.65,38.92 39.35,44.64 39.38,44.68 v39.38,45.35
  Top 0.406: 33.71,37.05 IC9.13
  Bottom 0.254: v39.38,45.35 39.38,54.33 40.75,55.7 45.26,55.7 48.16,58.6 48.16,65.82 v47.89,66.09
PA8
  Top 0.254: JP6.5 9.3,77.72 9.34,77.72 12.52,74.55 15.67,74.55 UC1.29
PA9  (via drill 0.61)
  Top 0.254: JP4.7 45.22,65.02 v44.47,65 | v26.71,63.49 26.25,63.97 25.54,63.97 UC1.30 15.43,74.08 11.37,74.08 v10.36,75.09
  Bottom 0.254: JP3.2 4.23,92.96 6.33,90.87 6.33,77.17 8.4,75.09 v10.36,75.09 | v26.71,63.49 27.3,62.9 42.4,62.92 v44.47,65
PA10  (via drill 0.61)
  Top 0.254: 9.09,76.62 v9.1,76.64 9.07,76.6 9.07,75.08 10.61,73.53 15.27,73.53 UC1.31 25.51,63.29 v25.51,63.02 | v46.19,69.86 57.04,69.86 JP4.5
  Bottom 0.254: JP3.3 2.87,95.58 3.72,95.58 9.1,90.2 v9.1,76.64 | v25.51,63.02 26.11,62.42 44.42,62.42 46.19,64.19 46.19,69.59 v46.19,69.86
PA11
  Top 0.254: UC1.32 16.33,71.77 6.19,71.77 2.77,75.18 JP6.6
PA12  (via drill 0.61)
  Top 0.254: UC1.33 21.71,65.68 v17.52,65.68
  Top 0.406: R29.2 18.72,13.19 v19.03,12.87 | v17.52,62.23 17.52,61 v19.24,59.3
  Bottom 0.406: v19.03,12.87 19.03,39.29 17.54,40.79 17.54,57.6 v19.24,59.3 | v17.52,65.68 v17.52,62.23
PA15  (via drill 0.61)
  Top 0.254: 23.1,59.83 UC1.38 23.17,59.91 20.97,57.71 19.11,57.71 16.32,60.49 16.29,60.97 v16.29,61.53 | JP4.4 57.28,72.71 56.78,73.21 40.22,73.21 v39.57,73.19 | v22.49,73.14 22.99,73.14 v24.26,74.41
  Bottom 0.254: v24.26,74.41 25.48,73.19 v39.57,73.19 | v22.49,73.14 21.55,72.19 16.15,66.78 16.15,61.67 v16.29,61.53
PB0  (via drill 0.61)
  Top 0.254: UC1.18 37.91,71.12 v49.57,71.12 | v26.73,32.98 26.73,31.35 R21.2
  Bottom 0.254: v26.73,32.98 27.54,33.79 28.29,33.79 33.14,38.64 38.05,38.64 40.92,41.52 46.24,41.52 50.12,45.4 50.12,70.57 v49.57,71.12
PB1  (via drill 0.61)
  Top 0.254: UC1.19 38.32,72.23 v50.56,72.21
  Top 0.406: R20.2 28.02,11.35 28.02,11.55 v28,11.57
  Bottom 0.254: v28,11.57 27.98,32.47 33.48,37.99 38.27,37.99 41.15,40.87 46.83,40.87 50.92,44.96 50.94,70.05 50.94,71.84 v50.56,72.21
PB4
  Top 0.254: UC1.40 9.64,44.96 JP5.3
PB5
  Top 0.254: UC1.41 7.8,42.42 JP5.4
PB6  (via drill 0.61)
  Top 0.254: UC1.42 13.73,47.64 v13.73,46.1 | 19.12,41.73 v13.68,41.73
  Top 0.406: R12.2 19.96,28.99 v20.62,29.66 | v19.13,41.71 19.12,41.73
  Bottom 0.254: v20.62,29.66 20.62,40.22 v19.13,41.71 | v13.73,46.1 13.73,41.78
  Bottom 0.406: 13.73,46.24 v13.73,46.1 | 13.73,41.78 v13.68,41.73
PB7
  Top 0.254: 4.14,37.34 JP5.6 6.5,37.34 16.46,47.3 16.46,49.66 UC1.43
PB8
  Top 0.254: 3.01,34.8 JP5.7 4.75,34.8 16.96,46.96 16.96,48.74 UC1.45
PB12
  Top 0.254: UC1.25 5.16,87.88 JP6.1
PB15  (via drill 0.61)
  Top 0.254: UC1.28 15.11,75.81 | 15.11,75.81 10.66,80.26 JP6.4 | v13.7,75.81 15.11,75.81
  Top 0.406: IC1.5 32.42,77.02 31.56,77.87 22.87,77.87 22.56,77.56 v18.28,77.56
  Bottom 0.406: v18.28,77.56 15.45,77.56 v13.7,75.81
PC13
  Top 0.254: UC1.2 36.87,49.07 43.99,49.05 arc2 53.84,38.88 JP7.6
  Bottom 0.254: 57.15,35.43 JP7.6
PC14
  Top 0.254: UC1.3 37.13,49.55 45.67,49.55 54.16,41.06 54.33,40.92 JP7.5
PC15
  Top 0.254: UC1.4 37.34,50.04 47.72,50.04 52.4,45.36 54.8,43 JP7.4
POT_G  (via drill 0.61)
  Top 0.406: R35.1 26.24,13.2 | 26.24,13.2 26.24,13.48 C17.1 | IC7.2 25.43,18.36 25.43,14.62 26.03,14.02 26.03,13.92 C17.1 | 26.03,13.58 26.24,13.2 | R40.2 35.51,12.27 32.8,12.27 30.48,14.59 30.48,15.18 R42.2 28.11,15.21 26.66,13.77 26.1,13.77 C17.1 | R40.2 35.74,12.04 | 35.7,12.03 R40.2 | v42.5,10.9 36.64,10.9 36.28,10.9 35.73,11.46 R40.2
  Bottom 0.406: v42.5,10.9 44.3,9.1 53.48,9.1 57.28,5.31 JP10.2
POT_G2  (via drill 0.61)
  Top 0.406: IC7.6 26.71,25.13 29.8,28.22 32.99,28.22 33.54,28.77 38.61,28.77 v39.12,28.25 | v50.49,25.37 53.59,22.25 | 53.59,22.25 | 53.59,22.25 53.58,20.53 R16.2 53.56,17.38 R15.1 51.98,17.05 | R14.2 49.43,17 C6.1 50.69,17.05 51.98,17.05 | v51.93,18.96 51.93,17.25 51.98,17.05
  Bottom 0.406: v50.49,25.37 48.02,27.84 39.5,27.86 v39.12,28.25 | v51.93,18.96 55.34,18.96 JP11.2
POT_P  (via drill 0.61)
  Top 0.406: IC5.2 35.03,18.44 R52.1 33.88,17.23 33.88,16.2 35.58,14.67 43.75,14.67 43.6,14.67 v50.3,8.02
  Bottom 0.406: JP10.1 51.9,8.04 50.32,8.04 v50.3,8.02
POT_P2  (via drill 0.61)
  Top 0.406: v54.25,12.77 53.16,12.77 R13.1 52.9,11.73 51.2,10.03 49.57,10.03 44.35,15.29 36.55,15.29 v36.14,15.7 | v37.26,26.93 37.02,26.93 36.3,26.2 IC5.6
  Bottom 0.406: JP11.1 55.95,14.48 v54.25,12.77 | v36.14,15.7 36.14,15.75 36.43,16.05 | 36.43,16.05 | 36.43,16.05 36.59,16.2 36.64,26.32 v37.26,26.93
PPP  (via drill 0.61)
  Top 0.406: v22.51,22.44 22.89,22.03 25.17,22.03 25.44,22.3 IC7.7 25.44,24.79 27.18,26.52 27.18,28.27 | v40.05,13.56 41.85,13.58 v43.63,11.83 | v49.82,13.18 49.81,14.46 C6.2 50.69,15.35 R15.2 | 27.18,28.27 | 27.18,28.27 R21.1
  Bottom 0.406: v22.51,22.44 22.12,22.05 22.15,22.05 22.15,12.89 24.52,10.53 34.98,10.53 38.01,13.56 v40.05,13.56 | v43.63,11.83 48.49,11.83 v49.82,13.18
RESET  (via drill 0.61)
  Top 0.254: 2.79,54.74 2.79,54.99 R17.2 2.54,54.99 | 2.54,57.53 2.29,57.79 C7.1 | UC1.7 28.18,61.33 24.96,61.33 v24.89,61.26 | v11.4,64.64 v4.92,64.64
  Top 0.406: 2.29,57.79 2.29,59.45 v2.3,59.46 | 2.79,54.99 2.79,55.09 2.38,55.41 2.38,57.51 C7.1
  Bottom 0.254: 3.05,62.1 RESET.A | 3.05,61.85 RESET.A | v4.92,64.64 4.15,64.64 2.92,63.4 2.92,62.07 RESET.A | v11.4,64.64 15.59,60.42 20.81,60.42 21.72,61.33 24.83,61.33 v24.89,61.26
  Bottom 0.406: v2.3,59.46 2.97,60.12 RESET.A | RESET.A' 2.95,66.6 v4.92,64.64
SPI2-CLK
  Top 0.254: JP6.2 6.99,85.34 UC1.26 27.09,65.25 27.54,65.25 27.84,65.56 27.84,66.01 31.15,69.31 IC1.4
SPI2-MISO
  Top 0.254: UC1.27 8.83,82.8 JP6.3
TRIG-OUT1  (via drill 0.61)
  Top 0.305: 20.56,33.21 20.56,33.23
  Top 0.406: 16.05,28.7 20.56,33.21 | 20.56,33.23 21.96,34.63 v24.62,34.65 | JP13.2 56.06,32.71 53.66,35.08 49.14,39.6 45.18,39.6 v45.4,39.55 | v31.17,34.25 28.27,34.25 v27.74,34.79 | IC4.7 16.56,24.33 16.07,24.82 16.07,26.23 R7.1 16.05,28.7 | 16.05,28.7 16.07,28.67
  Bottom 0.406: v24.62,34.65 27.43,34.66 v27.74,34.79 | v45.4,39.55 41.1,39.55 39.76,38.21 | 39.76,38.21 | 39.76,38.21 39.19,37.65 | 39.19,37.65 | 39.19,37.65 38.92,37.37 33.95,37.37 31.17,34.6 v31.17,34.25
TRIG-OUT2  (via drill 0.61)
  Top 0.61: v17.97,8.52 15.29,11.19 15.29,12.8 15.28,14.17 R10.1 15.29,14.5 IC4.1
  Bottom 0.61: v17.97,8.52 31.55,8.52 34.31,8.52 36.91,8.52 36.91,8.55 40.74,12.32 43.84,15.43 | 43.84,15.43 | 43.84,15.43 49.26,20.85 | 49.26,20.85 | 49.26,20.85 52.24,23.83 JP13.1
VCC  (via drill 0.61)
  Top 0.406: IC5.8 33.76,25.29 33.73,25.26 33.72,25.25 32.78,25.25 | v43.41,29.49 43.43,29.01 42.97,28.54 42.97,27.5 IC10.8 | v32.78,26.44 v32.78,26.43 32.78,25.25 | 32.78,25.25 32.77,25.26 C23.1
  Top 0.61: C28.1 7.13,23.4 IC2.8 7.2,23.27 7.2,22.1 8.06,21.24 14.23,21.24 15.28,22.29 15.28,22.49 | IC4.8 15.28,23.43 15.28,22.49 | 15.28,22.49 16.55,21.22 31.15,21.22 32.58,22.65 38.1,22.65 41.06,25.61 42.42,25.61 43,26.2 IC10.8
  Top 0.914: v54.5,95.91 54.5,89.7 v47.04,82.24 47.04,82.5 v43.49,86.05
  Bottom 0.406: v43.41,29.49 42.86,29.86 41.08,29.86 41.05,29.83 34.56,29.83 32.78,28.05 v32.78,26.44
  Bottom 0.813: v47.04,82.24 52.88,76.41 52.88,40.92 52.89,39.88 52.89,34.27 51.31,32.69 | 52.89,34.22 51.31,32.69 | 51.31,32.69 47.97,29.47 43.6,29.47 v43.41,29.49
  Bottom 0.914: D1.C 27.26,96.34 27.26,93.39 26.74,93.26 C25.+ 26.85,93.53 26.85,91.95 28.2,90.6 R49.2 29.01,90.56 29.01,88.48 31.44,86.05 v43.49,86.05 | JP8.4 55.88,96.65 v54.5,95.91
VEE  (via drill 0.61)
  Top 0.406: IC5.4 38.45,19.12 38.45,17.61 C20.2
  Top 0.61: C27.2 20.97,16.77 IC4.4 19.1,19.66 18.74,20.02 | 8.64,20.01 6.57,20.02 | 6.57,20.02 11.26,20.02 | 11.26,20.02 18.74,20.02 | 18.74,20.02 31.58,20.02 33.21,21.65 37.63,21.65 | 37.63,21.65 38.44,21.65 41.39,24.6 41.39,24.62 41.49,24.72 45.98,24.72 46.79,23.91 46.79,22.29 IC10.4 | IC2.4 11.04,19.8 11.26,20.02 | IC5.4 37.57,21.59 37.63,21.65 | v3.22,30.6 3.21,24.09 3.17,23.95 3.19,23.4 6.57,20.02
  Top 0.914: v52.98,92.48 52.98,92.46 v47.87,87.35
  Bottom 0.61: 24.67,82.33 R51.1
  Bottom 0.914: D2.A 12.48,93.58 | 12.48,93.58 C30.- | JP8.3 54.61,94.11 v52.98,92.48 | v47.87,87.35 44.78,84.27 26.45,84.27 24.67,82.48 24.67,82.75 R51.1 | 12.48,93.58 12.17,93.64 12.15,79.72 | 12.15,79.72 22.53,79.72 24.67,81.87 24.67,82.33 | 12.15,79.72 12.15,67.58 8.93,64.36 8.93,36.31 v3.22,30.6
VV  (via drill 0.61)
  Top 0.406: 41.68,20.95 C29.2 R55.2 41.82,17.85 41.82,17.11 42.54,16.39 45.16,16.39 46.35,17.58 R56.1 | 41.68,20.95 IC10.1 | 41.68,20.95 41.68,20.01 41.68,20.97 v40.7,21.94 | JP5.5 7.44,39.88 v10.25,42.69 | v13.06,39.81 23.51,39.81 v24.89,38.42 | v40.39,26.57 40.39,26.85 40.77,27.22 40.77,27.26 40.82,27.31 40.82,29.64 41.25,30.07 v41.25,30.98 | v41.25,33.81 35.7,33.81 35.49,33.81 34.7,34.6 33.9,35.4 30.84,35.4 v27.81,38.42
  Bottom 0.406: v40.7,21.94 40.7,26.26 v40.39,26.57 | v10.25,42.69 10.25,42.62 v13.06,39.81 | v24.89,38.42 v27.81,38.42 | v41.25,30.98 v41.25,33.81 | v41.25,33.81
VVA  (via drill 0.61)
  Top 0.254: v6,18.21 7.12,18.21 IC2.1
  Top 0.61: IC2.1 7.25,16.05 C3.2 5.32,15.02 4.71,14.26 4.71,11.3 R5.1 5.67,10 R6.2
  Bottom 0.254: JP5.2 5.26,45.16 5.26,34.58 1.85,31.17 1.85,22.36 v6,18.21

### Text on the board
tNames: 12v | 2.5v Ref. | -10v Ref. | -12v | 12v | -12v | 3.3v | GND | PB12 | PB13 | PB14 | PB15 | GENESYS V 1.0 | PB11 | PA8 | PB10 | PA11 | PA15 | PA6 | PA10 | PA9 | PA4 | BOOT | PA3 | 3.3 | 1 | 0 | A_REF | | | | | 2.5v | 3.3v | PA2 | PA1 | PB4 | PB5 | PA0 | 15 | PB6 | 14 | PB7 | PB8 | PC13 | A | B | TRIG OUT | B | A | CV OUT | IN- | IN+ | CV B | IN- | IN+ | CV A
bNames: GND | 12v | SERIAL PROG | | | RED STRIP | 2.5v Ref. | -10v Ref. | -12v | 12v | RX | -12v | TX | 3.3v | DAC | GND | PB12 | | | | | | | PB13 | | | | | PB14 | | | PB15 | PB11 | GENESYS V 1.0 | PA8 | PB10 | PA11 | PA15 | PA10 | PA6 | DIO | 3.3 | PA9 | | | CLK | PA4 | | | BOOT | PA3 | GND | 1 | 0 | PA2 | PB4 | PA1 | PA0 | PB5 | 15 | PB6 | 14 | TRIG OUT | PB7 | PB8 | B | A | PC13 | CV OUT | B | A | CV B | IN- | IN+ | CV A | IN- | IN+